# Altium schematic sheet DEBOUNCE CIRCUIT & VOLTAGE SUPERVISOR.SchDoc
size A4; SheetNumber: 18; SheetTotal: 19
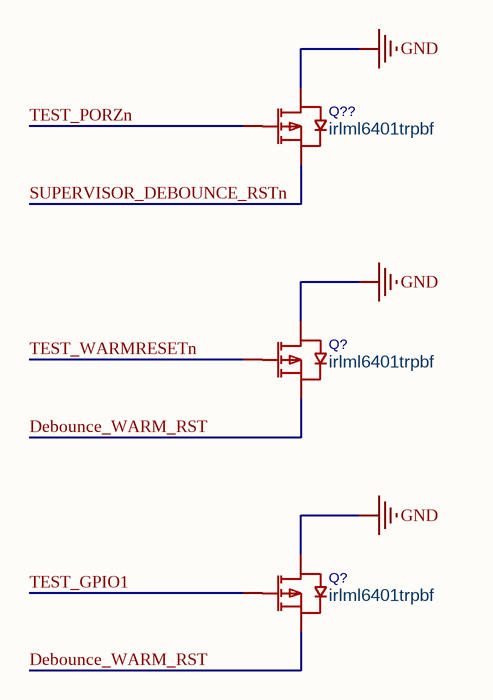
[diagram p0: DEBOUNCE CIRCUIT & VOLTAGE SUPERVISOR.SchDoc]

## Parts
(Parts that share a designator on the sheet are numbered #1, #2 ... from top to bottom, then left to right.)
Q?#1  irlml6401trpbf  [SOT-23-3_L2.9-W1.3-P1.90-LS2.4-BR]
Q?#2  irlml6401trpbf  [SOT-23-3_L2.9-W1.3-P1.90-LS2.4-BR]
Q??  irlml6401trpbf  [SOT-23-3_L2.9-W1.3-P1.90-LS2.4-BR]

## Nets
GND: Q?#1.3(D) Q?#2.3(D) Q??.3(D)
Debounce_WARM_RST: Q?#1.2(S) Q?#2.2(S)
SUPERVISOR_DEBOUNCE_RSTn: Q??.2(S)
TEST_GPIO1: Q?#2.1(G)
TEST_PORZn: Q??.1(G)
TEST_WARMRESETn: Q?#1.1(G)

## Library data of the parts
Q?#1 Q?#2 Q?? = irlml6401trpbf: 数量:1个P沟道;漏源电压(Vdss):12V;连续漏极电流(Id):4.3A;导通电阻(RDS(on)):50mΩ@4.5V;耗散功率(Pd):1.3W;阈值电压(Vgs(th)):950mV;; Manufacturer: Infineon(英飞凌); AddInBom: yes; ModelId: c62791f0466c4ae2a892c056b845b0ca; ModelName: SOT-23-3P_L2.9-W1.3-H1.0-LS2.4-P0.95; ModelTransform: 98.425,114.173,0,180,0,0,0.0005,-0.0005,0; Number: 1个P沟道; Drain to Source Voltage: 12V; Current - Continuous Drain(Id): 4.3A; Pd - Power Dissipation: 1.3W; Gate Threshold Voltage (Vgs(th)): 950mV; Gate Charge(Qg): 15nC@5V; Input Capacitance(Ciss): 830pF; Reverse Transfer Capacitance (Crss@Vds): 125pF; Type: P沟道; Output Capacitance(Coss): 180pF; Vgs: ±8V; Symbol: IRLML6401TRPBF; LCSC Part Name: 1个P沟道 耐压:12V 电流:4.3A; SupplierPart: C3034; ManufacturerPart: IRLML6401TRPBF; Supplier Footprint: SOT-23; JLCPCB Part Class: Extended Part; Datasheet: https://item.szlcsc.com/datasheet/IRLML6401TRPBF/3416.html; Supplier: LCSC; ConvertToPcb: yes; FootprintName: SOT-23-3_L2.9-W1.3-P1.90-LS2.4-BR; RDS(on): 50mΩ@4.5V; Operating Temperature: -55℃~+150℃; Configuration: -